# Altium schematic sheet Interfacing.SchDoc
size A4; SheetNumber: 2; SheetTotal: 4
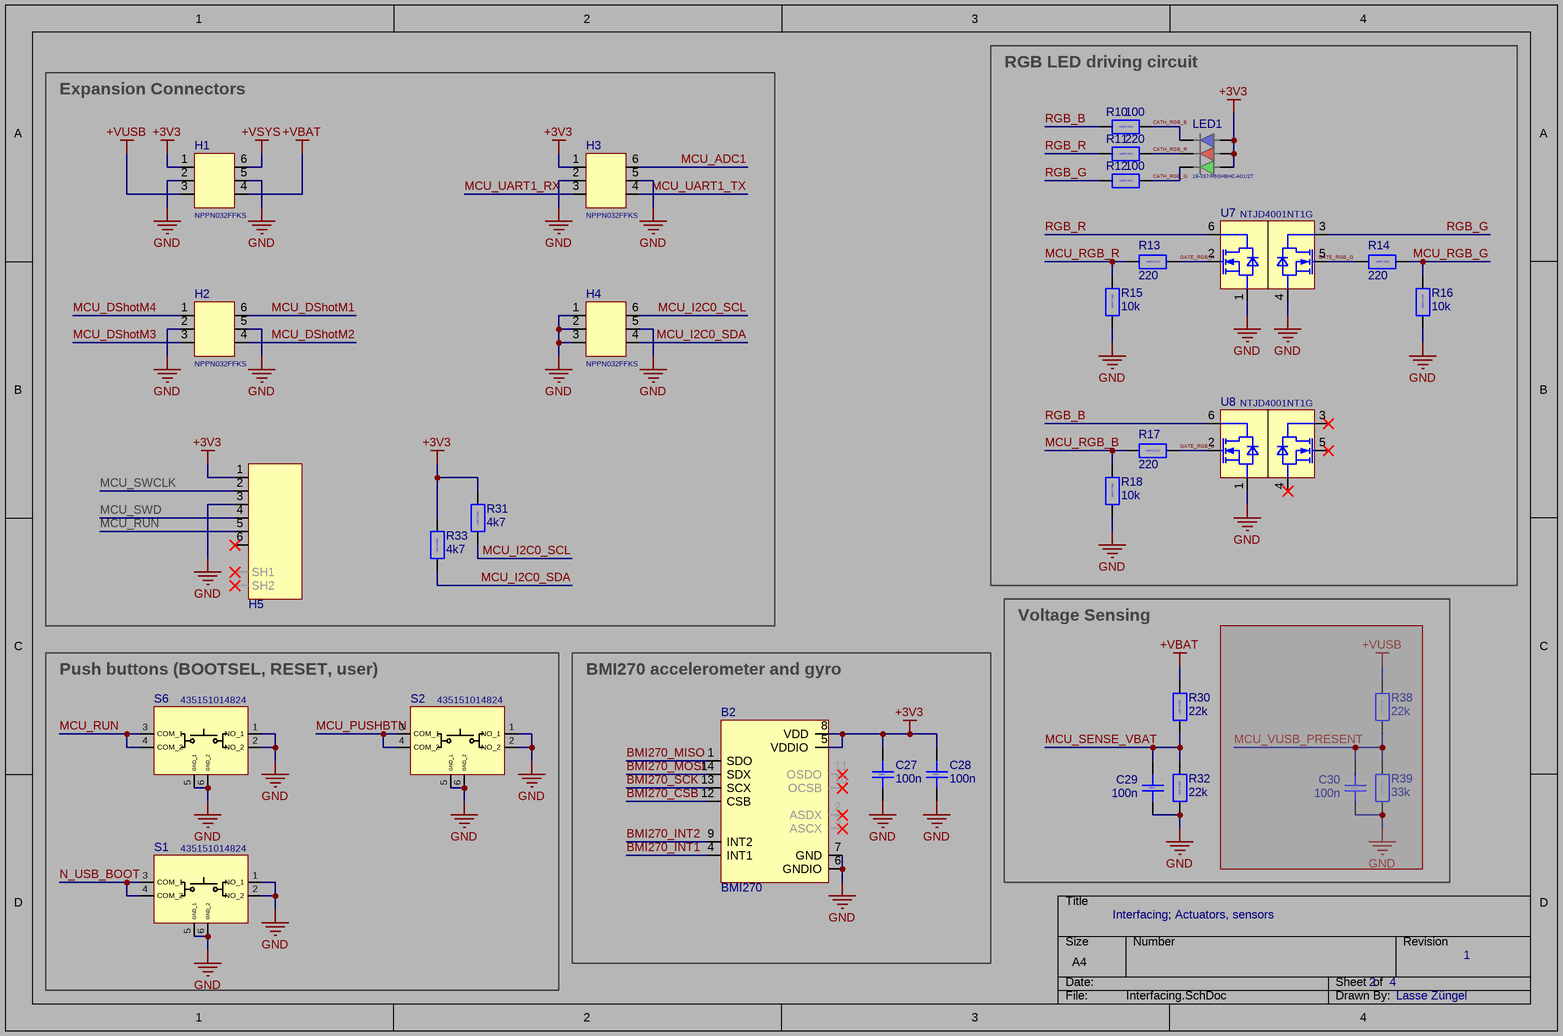
[diagram p0: Interfacing.SchDoc]

## Parts
B2  BMI270  [BMI270]
C27  100n  [CAP_0402]
C28  100n  [CAP_0402]
C29  100n  [CAP_0402]
C30  100n  [CAP_0402]  (masked out: inside a compile mask, not in the netlist)
H1  NPPN032FFKS  [NPPN032FFKS]
H2  NPPN032FFKS  [NPPN032FFKS]
H3  NPPN032FFKS  [NPPN032FFKS]
H4  NPPN032FFKS  [NPPN032FFKS]
H5  AMPHENOL-10147606-00006LF  [AMPHENOL-10147606-00006LF]  (value not drawn)
LED1  19-337/R6GHBHC-A01/2T  [RGB_SMD_1616]
R10  100  [RES_0402]
R11  220  [RES_0402]
R12  100  [RES_0402]
R13  220  [RES_0402]
R14  220  [RES_0402]
R15  10k  [RES_0402]
R16  10k  [RES_0402]
R17  220  [RES_0402]
R18  10k  [RES_0402]
R30  22k  [RES_0402]
R31  4k7  [RES_0402]
R32  22k  [RES_0402]
R33  4k7  [RES_0402]
R38  22k  [RES_0402]  (masked out: inside a compile mask, not in the netlist)
R39  33k  [RES_0402]  (masked out: inside a compile mask, not in the netlist)
S1  435151014824  [435151014824]
S2  435151014824  [435151014824]
S6  435151014824  [435151014824]
U7  NTJD4001NT1G  [SOT363/SC-88]
U8  NTJD4001NT1G  [SOT363/SC-88]

## Blocks framed on the sheet
Expansion Connectors: H1-H5 R31 R33
RGB LED driving circuit: LED1 R10-R18 U7 U8
Voltage Sensing: C29 C30 R30 R32 R38 R39
Push buttons (BOOTSEL, RESET, user): S1 S2 S6
BMI270 accelerometer and gyro: B2 C27 C28

## Nets
+3V3: B2.5(VDDIO) B2.8(VDD) C27.2 C28.2 H1.1 H3.1 H5.1 LED1.4 LED1.5 LED1.6 R31.2 R33.2
+VBAT: H1.4 R30.2
+VSYS: H1.6
+VUSB: H1.3
GND: B2.6(GNDIO) B2.7(GND) C27.1 C28.1 C29.1 H1.2 H1.5 H2.2 H2.5 H3.2 H3.5 H4.1 H4.2 H4.3 H4.5 H5.3 R15.2 R16.2 R18.2 R32.1 S1.1(NO_1) S1.2(NO_2) S1.5(GND_1) S1.6(GND_2) S2.1(NO_1) S2.2(NO_2) S2.5(GND_1) S2.6(GND_2) S6.1(NO_1) S6.2(NO_2) S6.5(GND_1) S6.6(GND_2) U7.1(S1) U7.4(S2) U8.1(S1)
BMI270_CSB: B2.12(CSB)
BMI270_INT1: B2.4(INT1)
BMI270_INT2: B2.9(INT2)
BMI270_MISO: B2.1(SDO)
BMI270_MOSI: B2.14(SDX)
BMI270_SCK: B2.13(SCX)
CATH_RGB_B: LED1.1 R10.1
CATH_RGB_G: LED1.3 R12.1
CATH_RGB_R: LED1.2 R11.1
GATE_RGB_B: R17.2 U8.2(G1)
GATE_RGB_G: R14.2 U7.5(G2)
GATE_RGB_R: R13.2 U7.2(G1)
MCU_ADC1: H3.6
MCU_DShotM1: H2.6
MCU_DShotM2: H2.4
MCU_DShotM3: H2.3
MCU_DShotM4: H2.1
MCU_I2C0_SCL: H4.6 R31.1
MCU_I2C0_SDA: H4.4 R33.1
MCU_PUSHBTN: S2.3(COM_1) S2.4(COM_2)
MCU_RGB_B: R17.1 R18.1
MCU_RGB_G: R14.1 R16.1
MCU_RGB_R: R13.1 R15.1
MCU_RUN: H5.5 S6.3(COM_1) S6.4(COM_2)
MCU_SENSE_VBAT: C29.2 R30.1 R32.2
MCU_SWCLK: H5.2
MCU_SWD: H5.4
MCU_UART1_RX: H3.3
MCU_UART1_TX: H3.4
N_USB_BOOT: S1.3(COM_1) S1.4(COM_2)
RGB_B: R10.2 U8.6(D1)
RGB_G: R12.2 U7.3(D2)
RGB_R: R11.2 U7.6(D1)

Not connected (* = marked no-connect by the designer): B2 2(ASDX)* 3(ASCX)* 10(OCSB)* 11(OSDO)*; H5 6* SH1* SH2*; U8 3(D2)* 4(S2)* 5(G2)*

## Notes on the sheet
- Interfacing; Actuators, sensors
- 2    4
- 1
- Lasse Züngel
- (in symbol CAP_0402) 0402
- (in symbol RES_0402) 0402 1/16W

## Library data of the parts
B2 = BMI270: IMUs - Inertial Measurement Units Smart Ultra-Low Power Inertial Measurement Unit (IMU) for Wearable Applications; Manufacturer_Name: BOSCH; Geometry.Height: 0.87mm; Mouser Part Number: 262-BMI270; Mouser Price/Stock: https://www.mouser.co.uk/ProductDetail/Bosch-Sensortec/BMI270?qs=u16ybLDytRYIj%252BjQEee88A%3D%3D; Manufacturer_Part_Number: BMI270; Datasheet Link: https://www.bosch-sensortec.com/media/boschsensortec/downloads/datasheets/bst-bmi270-ds000.pdf
C27-C30 = CAP_0402: Capacitor 0402 generic
H1-H4 = NPPN032FFKS: CONN HDR 6POS 0.079 GOLD SMD 3x2, 2mm pitch
H5 = AMPHENOL-10147606-00006LF: Amphenol,1mm pitch, 6 Pos, 1 Row, SMD, Wire-to-Board, Right Angle, Male
LED1 = 19-337/R6GHBHC-A01/2T: 0.35mm Height Chip LED with Full Color, Everlight, 1616 SMD; Supplier 1: Digikey; Supplier Part Number 1: 1080-19-337/R6GHBHC-A01/2TCT-ND
R10-R18 R30-R33 R38 R39 = RES_0402: Resistor 0402 generic, 1/16W
S1 S2 S6 = 435151014824: Switch normally open (NO); Manufacturer_Name: Wurth Elektronik; Datasheet Link: https://componentsearchengine.com/Datasheets/2/435151014824.pdf; Height: 1.4mm; Manufacturer_Part_Number: 435151014824; Mouser Part Number: 710-435151014824; Mouser Price/Stock: https://www.mouser.co.uk/ProductDetail/Wurth-Elektronik/435151014824?qs=OlC7AqGiEDkCCtReGm3ZVw%3D%3D
U7 U8 = NTJD4001NT1G: MOSFETs 30V 250mA Dual N-Channel